# Altium schematic sheet Control.SchDoc
size Legal; SheetNumber: 1; SheetTotal: 1; SPICEModelCacheVIZEHTWB: <root> / <DocumentId>VIZEHTWB</DocumentId> / </root>
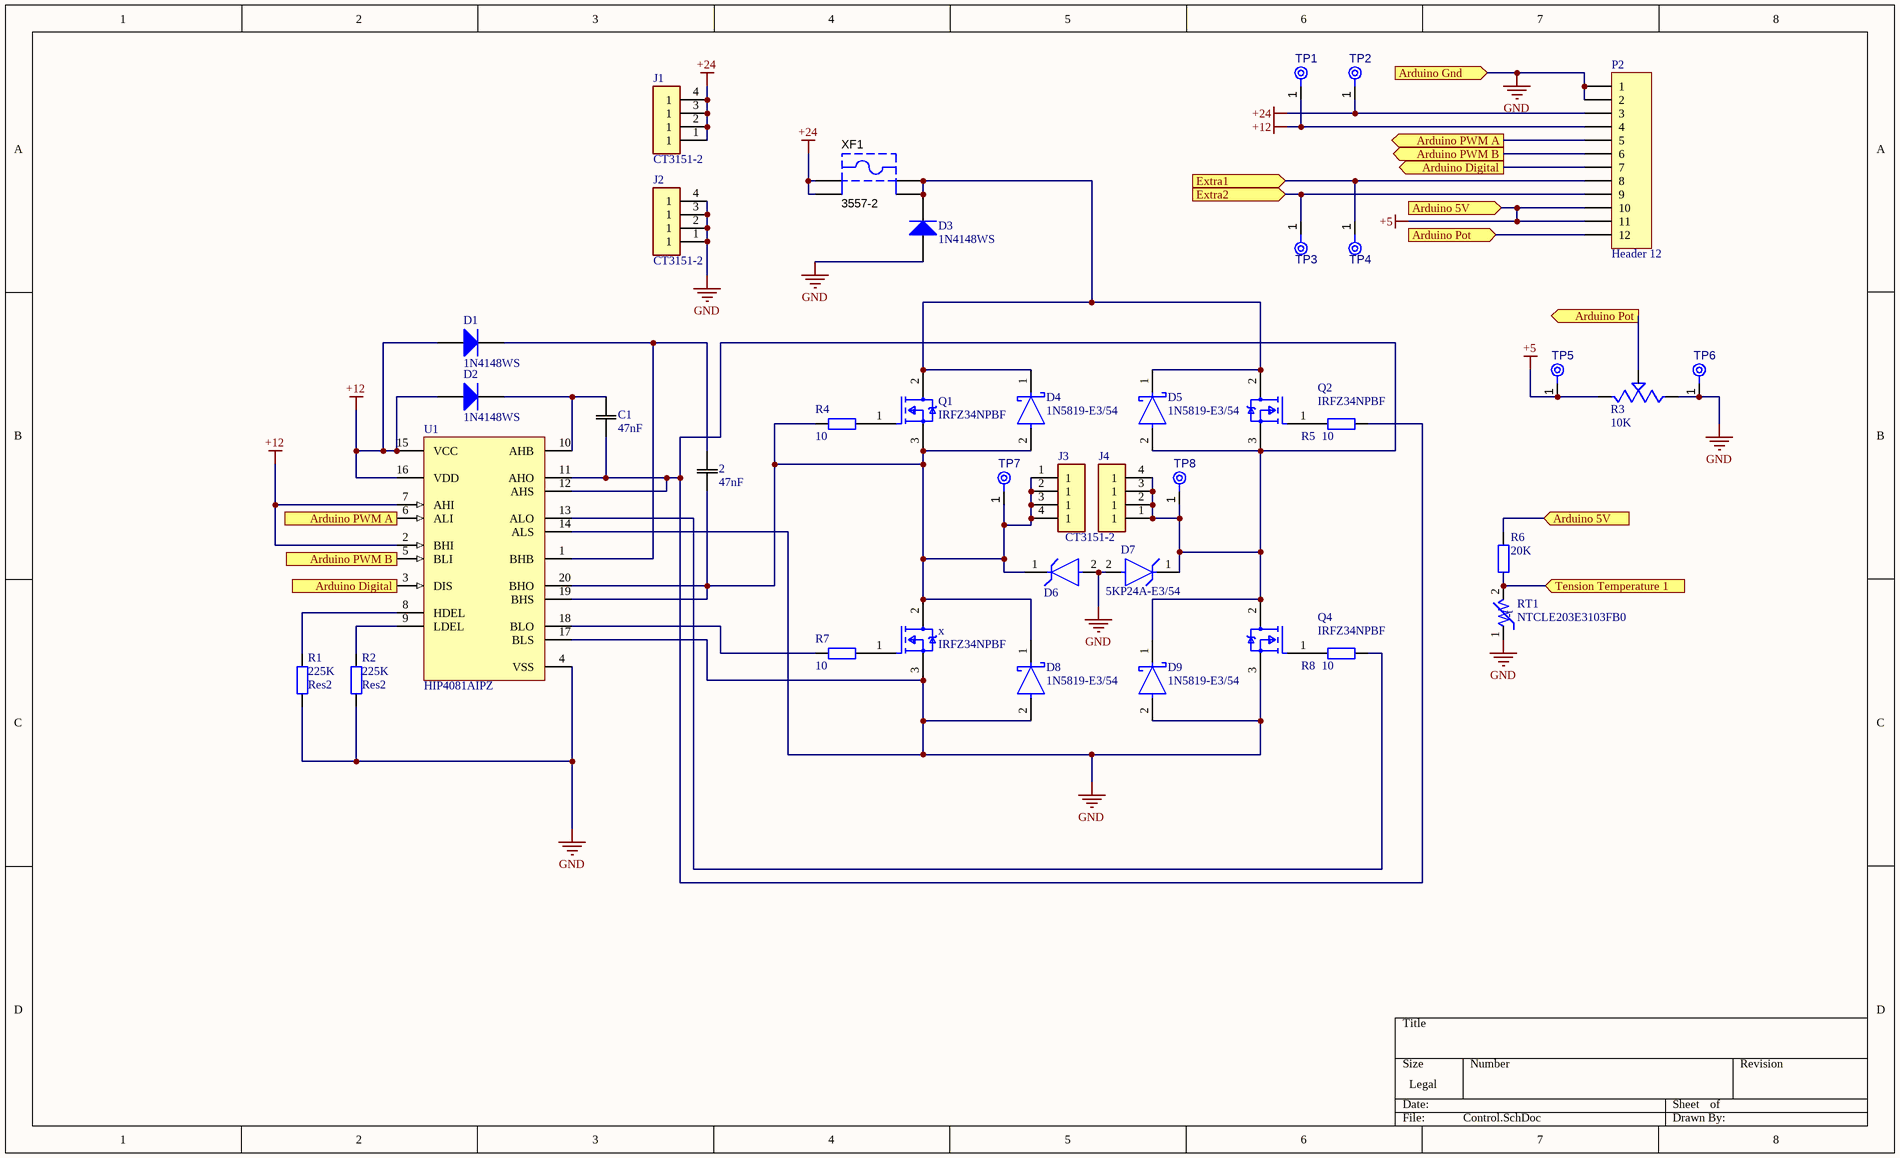
[diagram p0: Control.SchDoc]

## Parts
2  47nF  [CAPC17595_95N_KEM]
C1  47nF  [CAPC17595_95N_KEM]
D1  1N4148WS  [FAIR-SOD-323_V]
D2  1N4148WS  [FAIR-SOD-323_V]
D3  1N4148WS  [FAIR-SOD-323_V]
D4  1N5819-E3/54  [FP-1N5819-E3-54-MFG]
D5  1N5819-E3/54  [FP-1N5819-E3-54-MFG]
D6  5KP24A-E3/54  [FP-P600-MFG]  (value not drawn)
D7  5KP24A-E3/54  [FP-P600-MFG]
D8  1N5819-E3/54  [FP-1N5819-E3-54-MFG]
D9  1N5819-E3/54  [FP-1N5819-E3-54-MFG]
J1  CT3151-2  [CALTEST_CT3151-2]
J2  CT3151-2  [CALTEST_CT3151-2]
J3  CT3151-2  [CALTEST_CT3151-2]
J4  CT3151-2  [CALTEST_CT3151-2]  (value not drawn)
P2  Header 12  [HDR1X12]
Q1  IRFZ34NPBF  [FP-PG-TO220-3-MFG]
Q2  IRFZ34NPBF  [FP-PG-TO220-3-MFG]
Q4  IRFZ34NPBF  [FP-PG-TO220-3-MFG]
R1  Res2  value 225K  [AXIAL-0.4]
R2  Res2  value 225K  [AXIAL-0.4]
R3  10K  [TRIM_WH148-1A-2-18T-L20]
R4  value 10  [AXIAL-0.4]  (hidden comment: Res2)
R5  value 10  [AXIAL-0.4]  (hidden comment: Res2)
R6  value 20K  [AXIAL-0.4]  (hidden comment: Res2)
R7  value 10  [AXIAL-0.4]  (hidden comment: Res2)
R8  value 10  [AXIAL-0.4]  (hidden comment: Res2)
RT1  NTCLE203E3103FB0  [VARRB254W40L360T300H900]
TP1  TPAD6R  [TP06R]  (value not drawn)  (no BOM)
TP2  TPAD6R  [TP06R]  (value not drawn)  (no BOM)
TP3  TPAD6R  [TP06R]  (value not drawn)  (no BOM)
TP4  TPAD6R  [TP06R]  (value not drawn)  (no BOM)
TP5  TPAD6R  [TP06R]  (value not drawn)  (no BOM)
TP6  TPAD6R  [TP06R]  (value not drawn)  (no BOM)
TP7  TPAD6R  [TP06R]  (value not drawn)  (no BOM)
TP8  TPAD6R  [TP06R]  (value not drawn)  (no BOM)
U1  HIP4081AIPZ  [DIP762W46P254L2590H533Q20_E20_3_N]
x  IRFZ34NPBF  [FP-PG-TO220-3-MFG]
XF1  3557-2  [KSTN-3557-2]

## Ports
Arduino 5V (in, see Control[3A]), Arduino 5V (in, see Control[4B]), Arduino Digital (in, see Control[3A]), Arduino Digital (out, see Control[1C]), Arduino Gnd (in), Arduino Pot (in, see Control[4B]), Arduino Pot (out, see Control[3A]), Arduino PWM A (in, see Control[3A]), Arduino PWM A (out, see Control[1B]), Arduino PWM B (in, see Control[3A]), Arduino PWM B (out, see Control[1B]), Extra1 (in), Extra2 (in), Tension Temperature 1 (in)

## Nets
+5: P2.10 P2.11 R3.3 R6.2 TP5.1(TP) ; port Arduino 5V
+12: D1.1(A) D2.1(A) P2.4 TP1.1(TP) U1.2(BHI) U1.7(AHI) U1.15(VCC) U1.16(VDD)
+24: J1.1 J1.2(1) J1.3(1) J1.4(1) P2.3 TP2.1(TP) XF1.1 XF1.2
GND: D3.1(A) D6.2(A) D7.2(A) D8.2(A) D9.2(A) J2.1 J2.2(1) J2.3(1) J2.4(1) P2.1 P2.2 Q4.3(SOURCE) R1.1 R2.1 R3.1 RT1.1 TP6.1(TP) U1.4(VSS) U1.14(ALS) U1.17(BLS) x.3(SOURCE) ; port Arduino Gnd
Arduino Digital: P2.7 U1.3(DIS) ; port Arduino Digital
Arduino Pot: P2.12 R3.2 ; port Arduino Pot
Arduino PWM A: P2.5 U1.6(ALI) ; port Arduino PWM A
Arduino PWM B: P2.6 U1.5(BLI) ; port Arduino PWM B
Extra1: P2.8 TP4.1(TP) ; port Extra1
Extra2: P2.9 TP3.1(TP) ; port Extra2
Tension Temperature 1: R6.1 RT1.2 ; port Tension Temperature 1
Net2_1: 2.1 D4.2(A) D6.1(C) D8.1(C) J3.1 J3.2(1) J3.3(1) J3.4(1) Q1.3(SOURCE) R4.2 TP7.1(TP) U1.19(BHS) U1.20(BHO) x.2(DRAIN)
Net2_2: 2.2 D1.2(K) U1.1(BHB)
NetC1_1: C1.1 D5.2(A) D7.1(C) D9.1(C) J4.1 J4.2(1) J4.3(1) J4.4(1) Q2.3(SOURCE) Q4.2(DRAIN) R5.1 TP8.1(TP) U1.11(AHO) U1.12(AHS)
NetC1_2: C1.2 D2.2(K) U1.10(AHB)
NetD3_2: D3.2(K) D4.1(C) D5.1(C) Q1.2(DRAIN) Q2.2(DRAIN) XF1.3 XF1.4
NetQ1_1: Q1.1(GATE) R4.1
NetQ2_1: Q2.1(GATE) R5.2
NetQ4_1: Q4.1(GATE) R8.2
NetR1_2: R1.2 U1.8(HDEL)
NetR2_2: R2.2 U1.9(LDEL)
NetR7_1: R7.1 x.1(GATE)
NetR7_2: R7.2 U1.18(BLO)
NetR8_1: R8.1 U1.13(ALO)

## Notes on the sheet
- (in symbol NTCLE203E3103FB0) -t

## Library data of the parts
2 C1 = C0603C473K5RACTU: SMD Comm X7R, Ceramic, 0.047 uF, 10%, 50 VDC, X7R, SMD, MLCC, Temperature Stable, Class II, 0603; Manufacturer_Name: Kemet; Copyright: Copyright (C) 2026 Ultra Librarian. All rights reserved.; Manufacturer_Part_Number: C0603C473K5RACTU
D1-D3 = CMP-004-00001-2: Small Signal Diode, 75 V, 0.15 A, -55 to 150 degC, 2-Pin SOD-323, RoHS, Tape and Reel; Manufacturer: Fairchild; Recovery Time: 4ns; Forward Voltage: 1V; Peak Reverse Current: 5uA; Forward Current: 150mA; Capacitance: -323f; Datasheet URL: https://www.fairchildsemi.com/datasheets/1N/1N4148WS.pdf; Package Reference: SOD-323; Package Description: 2-Pin Small Outline Diode Flat Lead, Body 1.7 x 1.25 mm; Case/Package: SOD-323; Mounting Technology: SM; Manufacturer URL: https://www.fairchildsemi.com/; Pins: 2; Packaging: TapeandReel; Package Quantity: 3000; Min Operating Temperature: -55°C; RoHS Compliant: True; Max Operating Temperature: 150°C; Datasheet Version: Rev. 1.2, 03/2015
D4 D5 D8 D9 = CMP-02539-000037-2: DIODE SCHOTTKY 40V 1A DO204AL; Capacitance: 110pF; Element Configuration: Single; Peak Non-Repetitive Surge Current: 25A; Forward Voltage: 900mV; Polarity: Standard; Peak Reverse Current: 1mA; Max Operating Temperature: 125°C; Forward Current: 1A; Package Quantity: 1; Average Rectified Current: 1A; Voltage: 40V; Radiation Hardening: No; Current: 1A; Max Reverse Voltage (DC): 40V; Height: 2.7mm; Output Current: 1A; Lead Free: Lead Free; Diameter: 2.7mm; Min Operating Temperature: -65°C; Max Repetitive Reverse Voltage (Vrrm): 40V; Number of Pins: 2; Width: 2.7mm; Length: 5.2mm; Current Rating: 1A; Packaging: Tape and Reel; Mount: Through Hole; Max Forward Surge Current (Ifsm): 25A; Voltage Rating (DC): 40V
D6 D7 = CMP-00030-42333725-1: 5KP24A-E3/54 5000 W 24 V Uni DirectionalThrough Hole Transient Voltage Suppressor Diode; Max Power Dissipation: 5kW; Clamping Voltage: 38.9V; Element Configuration: Single; Max Junction Temperature (Tj): 175°C; Max Breakdown Voltage: 29.5V; Breakdown Voltage: 26.7V; Operating Supply Voltage: 24V; Max Surge Current: 129A; Test Current: 5mA; Number of Elements: 1; Max Reverse Leakage Current: 2µA; Height: 9.1mm; Diameter: 9.1mm; NexarPartId: 42333725; RoHS: Compliant; Mount: Through Hole; Min Operating Temperature: -55°C; Number of Pins: 2; Max Operating Temperature: 175°C; Length: 9.0932mm; Peak Pulse Current: 129A; Radiation Hardening: No; Min Breakdown Voltage: 26.7V; Direction: Unidirectional; Schedule B: 8541100080; Lead Free: Lead Free; Reverse Standoff Voltage: 24V; Reverse Breakdown Voltage: 26.7V; Packaging: Tape & Reel; Power Dissipation: 5kW; Polarity: Unidirectional; Termination: Axial; Peak Pulse Power: 5kW; REACH SVHC: Unknown; Case/Package: Axial; Leakage Current: 2µA; Number of Channels: 1
J1-J4 = CT3151-2: Banana Jack Connector Standard Banana Solder Red; MF: Cal Test; SnapEDA_Link: https://www.snapeda.com/parts/CT3151-2/Cal+Test+Electronics/view-part/?ref=snap; Package: None; Value: *; MP: CT3151-2; Check_prices: https://www.snapeda.com/parts/CT3151-2/Cal+Test+Electronics/view-part/?ref=eda
P2 = Header 12: Header, 12-Pin; LatestRevisionDate: 17-Jul-2002; LatestRevisionNote: Re-released for DXP Platform.; Publisher: Altium Limited
Q1 Q2 Q4 x = CMP-32901-000547-1: MOSFET N-CH 55V 29A TO220AB; Rise Time: 49ns; Turn-On Delay Time: 7ns; Input Capacitance: 700pF; Drain to Source Resistance: 40mR; Turn-Off Delay Time: 31ns; Power Dissipation: 68W; Gate to Source Voltage (Vgs): 20V; Element Configuration: Single; Threshold Voltage: 4V; Packaging: Rail/Tube; Number of Pins: 3; Height: 0.6inch; Case/Package: TO-220; Min Operating Temperature: -55°C; Max Operating Temperature: 175°C; RoHS Compliant: Yes; Width: 0.185inch; Lead Free: Lead Free; Contact Plating: Tin; Drain to Source Breakdown Voltage: 55V; Length: 0.414inch; Mount: Through Hole; Max Power Dissipation: 68W; Halogen Free: Not Halogen Free; Max Dual Supply Voltage: 55V; Rds On Max: 40mR; Continuous Drain Current (ID): 29A; Drain to Source Voltage (Vdss): 55V; REACH SVHC: No SVHC
R1 R2 R4-R8 = Res2: Resistor; Published: 8-Jun-2000; LatestRevisionDate: 17-Jul-2002; LatestRevisionNote: Re-released for DXP Platform.; PackageReference: AXIAL-0.4; Publisher: Altium Limited; PackageDescription: Axial Device, Thru-Hole; 2 Leads; 0.4 in Pin Spacing
R3 = WH148-1A-2-18T-L20: 16mm Rotary Potentiometers; MF: Kls electronics; SnapEDA_Link: https://www.snapeda.com/parts/WH148-1A-2-18T-L20/Kls+electronics/view-part/?ref=snap; Package: Package; Value: *; MP: WH148-1A-2-18T-L20; Check_prices: https://www.snapeda.com/parts/WH148-1A-2-18T-L20/Kls+electronics/view-part/?ref=eda
RT1 = NTCLE203E3103FB0: NTC Thermistors,NTC Ni 0.4 lead 10K 1% bulk e3 | Vishay Dale NTCLE203E3103FB0; SnapEDA_Link: https://www.snapeda.com/parts/NTCLE203E3103FB0/Vishay/view-part/?ref=snap; Package: None; Value: *; MF: Vishay; MP: NTCLE203E3103FB0; Check_prices: https://www.snapeda.com/parts/NTCLE203E3103FB0/Vishay/view-part/?ref=eda
TP1-TP8 = CMP-00028-00002-2: 0.6mm round; Pins: 1
U1 = CMP-00572-88252434-2: Driver 2.5A 4-OUT Hi/Lo Side Full Brdg/Half Brdg Inv/Non-Inv Automotive 20-Pin PDIP Tube; Manufacturer Lifecycle Status: ACTIVE; Nominal Supply Current: 10.5mA; Max Supply Voltage: 15V; Pitch: 2.5mm; Number of Channels: 4; RAM Size: 32kB; Max Power Dissipation: 440mW; Turn-On Delay Time: 110ns; Fall Time: 10ns; Number of Drivers: 1; Output Voltage: 12.6V; Propagation Delay: 30ns; Overload Protection: Under Voltage; Min Supply Voltage: 9.5V; Turn-Off Delay Time: 90ns; Max Supply Current: 15.5mA; Switching Frequency: 1MHz; Number of Pins: 20; ComponentLink2Description: Datasheet URL; ComponentLink1Description: Manufacturer's Website; Max Output Current: 2.5A; Max Output Voltage: 15V; REACH SVHC: No; Packaging: Bulk; Min Operating Temperature: -40°C; Height: 3.94mm; ComponentLink2URL: https://octopart.com/cad-content/api/get-model-datasheet/15189/88252434; ComponentLink3Description: Manufacturer's Package Drawing; Lead Free: Lead Free; Export Control Classification Number (ECCN) Code: EAR99; HelpURL: https://octopart.com/cad-content/api/get-model-datasheet/15189/88252434; Max Operating Temperature: 85°C; Rise Time: 10ns; ComponentLink1URL: http://www.renesas.com; Width: 6.6mm; Number of Outputs: 4; ComponentLink3URL: https://www.renesas.com/en/document/psc/e203-20-lead-dual-line-plastic-packages; Lifecycle Status: Production; Length: 26.2mm; Output Current: 2.5A; Mount: Through Hole; Case/Package: PDIP; RoHS: Compliant
XF1 = CMP-2000-05461-1: FUSE HOLDER, PCB MOUNT, 500VAC, 20A, ROHS; Manufacturer: Keystone-Electronics; Number of Circuits: 1; Voltage: 500V; Fuseholder Type: Block; Fuse Type: Blade; Fuse Size: 0.43"Lx0.15"Wx0.64"H(10.92mmx3.81mmx16.25mm); For Use With/Related Products: ATC,ATO257,MINI897; Current Rating: 30A; Datasheet URL: http://datasheet.octopart.com/3557-2-Keystone-datasheet-15715937.pdf; Orientation: Vertical; Family: Fuseholders; Datasheet Version: Apr-13; Contact Finish: TinNickel; Mounting Type: PCB; Series: -; Category: CircuitProtection; Termination Style: PCPin; Contact Material: Brass; Manufacturer URL: http://www.keyelco.com/